# Altium schematic sheet Interface_Sheet.SchDoc
size 420 x 297 mm; SheetNumber: 3; SheetTotal: 4
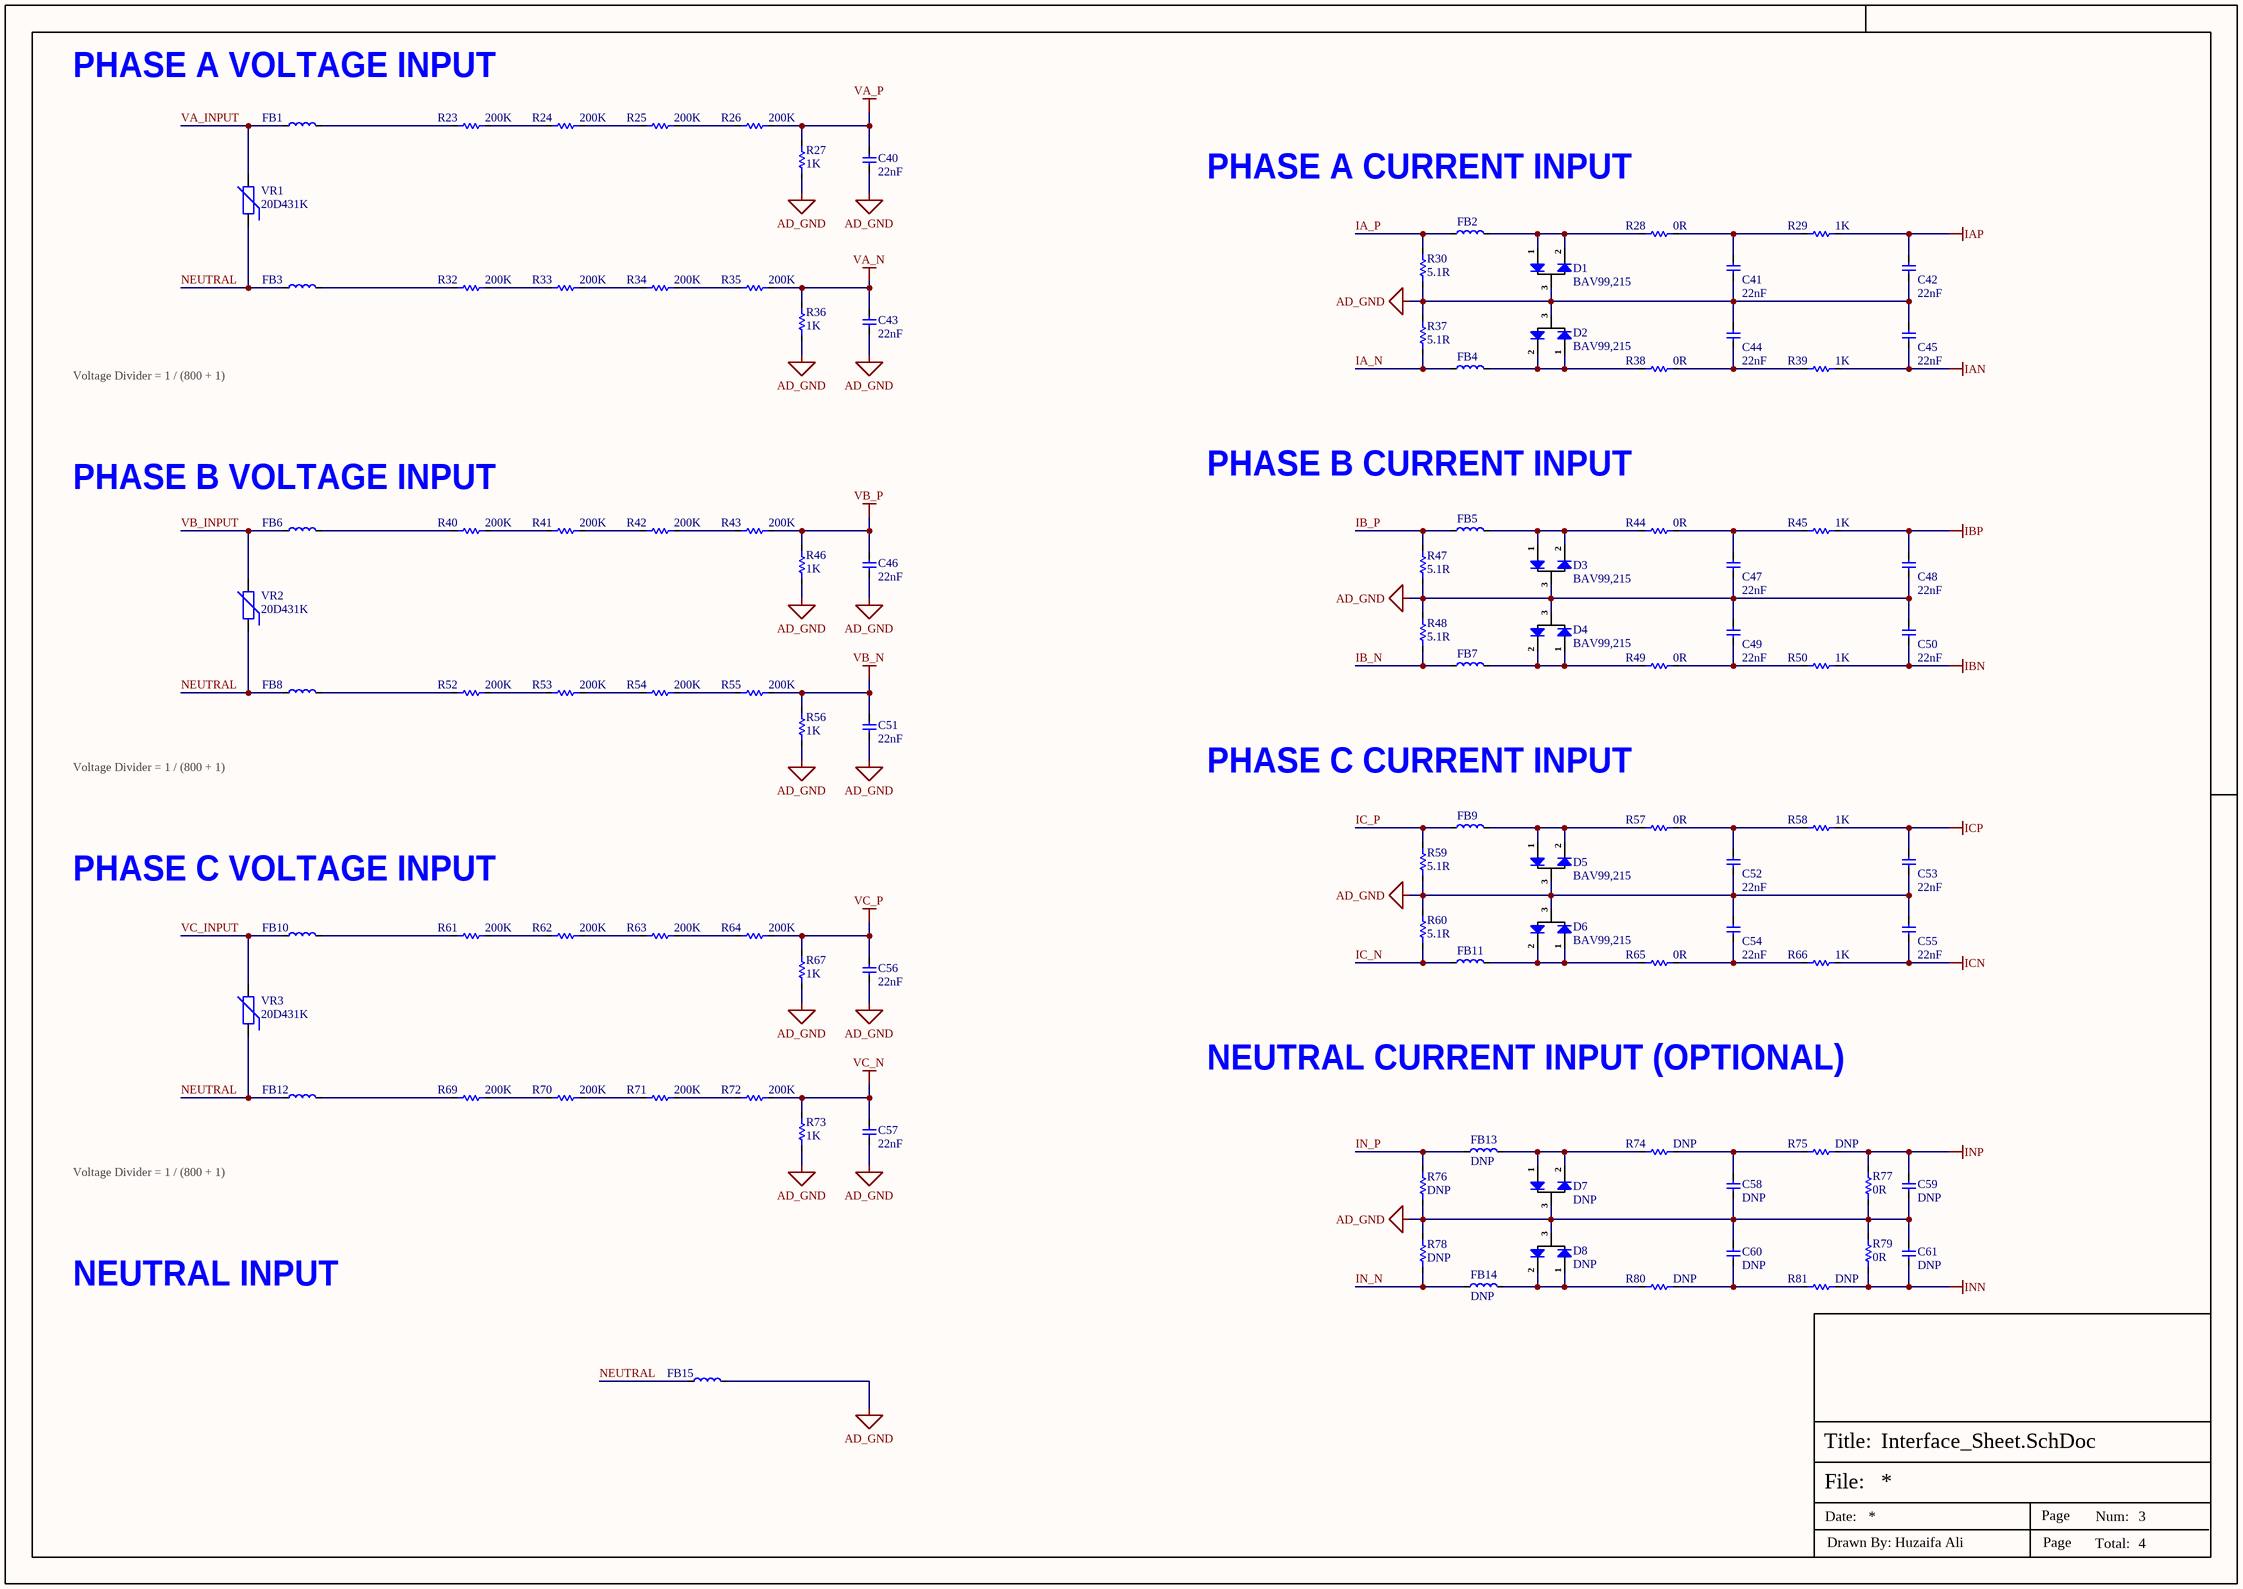
[diagram p0: Interface_Sheet.SchDoc]

## Parts
C40  22nF  [Cap-1206]
C41  22nF  [Cap-0603]
C42  22nF  [Cap-0603]
C43  22nF  [Cap-1206]
C44  22nF  [Cap-0603]
C45  22nF  [Cap-0603]
C46  22nF  [Cap-1206]
C47  22nF  [Cap-0603]
C48  22nF  [Cap-0603]
C49  22nF  [Cap-0603]
C50  22nF  [Cap-0603]
C51  22nF  [Cap-1206]
C52  22nF  [Cap-0603]
C53  22nF  [Cap-0603]
C54  22nF  [Cap-0603]
C55  22nF  [Cap-0603]
C56  22nF  [Cap-1206]
C57  22nF  [Cap-1206]
C58  DNP  [Cap-0805]  (no BOM)
C59  DNP  [Cap-0805]  (no BOM)
C60  DNP  [Cap-0805]  (no BOM)
C61  DNP  [Cap-0805]  (no BOM)
D1  BAV99,215  [SOT-23]
D2  BAV99,215  [SOT-23]
D3  BAV99,215  [SOT-23]
D4  BAV99,215  [SOT-23]
D5  BAV99,215  [SOT-23]
D6  BAV99,215  [SOT-23]
D7  DNP  [SOT-23]  (no BOM)
D8  DNP  [SOT-23]  (no BOM)
FB1  BLM21BD152SN1D  [Ind-0805]  (value not drawn)
FB2  BLM21BD152SN1D  [Ind-0805]  (value not drawn)
FB3  BLM21BD152SN1D  [Ind-0805]  (value not drawn)
FB4  BLM21BD152SN1D  [Ind-0805]  (value not drawn)
FB5  BLM21BD152SN1D  [Ind-0805]  (value not drawn)
FB6  BLM21BD152SN1D  [Ind-0805]  (value not drawn)
FB7  BLM21BD152SN1D  [Ind-0805]  (value not drawn)
FB8  BLM21BD152SN1D  [Ind-0805]  (value not drawn)
FB9  BLM21BD152SN1D  [Ind-0805]  (value not drawn)
FB10  BLM21BD152SN1D  [Ind-0805]  (value not drawn)
FB11  BLM21BD152SN1D  [Ind-0805]  (value not drawn)
FB12  BLM21BD152SN1D  [Ind-0805]  (value not drawn)
FB13  DNP  [Ind-0805]  (no BOM)
FB14  DNP  [Ind-0805]  (no BOM)
FB15  BLM21BD152SN1D  [Ind-0805]  (value not drawn)
R23  200K  [RES-2010]
R24  200K  [RES-2010]
R25  200K  [RES-2010]
R26  200K  [RES-2010]
R27  1K  [RES-2010]
R28  0R  [Res-0603]
R29  1K  [Res-0603]
R30  5.1R  [Res-1206]
R32  200K  [RES-2010]
R33  200K  [RES-2010]
R34  200K  [RES-2010]
R35  200K  [RES-2010]
R36  1K  [RES-2010]
R37  5.1R  [Res-1206]
R38  0R  [Res-0603]
R39  1K  [Res-0603]
R40  200K  [RES-2010]
R41  200K  [RES-2010]
R42  200K  [RES-2010]
R43  200K  [RES-2010]
R44  0R  [Res-0603]
R45  1K  [Res-0603]
R46  1K  [RES-2010]
R47  5.1R  [Res-1206]
R48  5.1R  [Res-1206]
R49  0R  [Res-0603]
R50  1K  [Res-0603]
R52  200K  [RES-2010]
R53  200K  [RES-2010]
R54  200K  [RES-2010]
R55  200K  [RES-2010]
R56  1K  [RES-2010]
R57  0R  [Res-0603]
R58  1K  [Res-0603]
R59  5.1R  [Res-1206]
R60  5.1R  [Res-1206]
R61  200K  [RES-2010]
R62  200K  [RES-2010]
R63  200K  [RES-2010]
R64  200K  [RES-2010]
R65  0R  [Res-0603]
R66  1K  [Res-0603]
R67  1K  [RES-2010]
R69  200K  [RES-2010]
R70  200K  [RES-2010]
R71  200K  [RES-2010]
R72  200K  [RES-2010]
R73  1K  [RES-2010]
R74  DNP  [Res-0603]  (no BOM)
R75  DNP  [Res-0603]  (no BOM)
R76  DNP  [Res-1206]
R77  0R  [Res-0402]
R78  DNP  [Res-1206]
R79  0R  [Res-0402]
R80  DNP  [Res-0603]  (no BOM)
R81  DNP  [Res-0603]  (no BOM)
VR1  20D431K  [20D431K]
VR2  20D431K  [20D431K]
VR3  20D431K  [20D431K]

## Nets
AD_GND: C40.1 C41.1 C42.1 C43.1 C44.2 C45.2 C46.1 C47.1 C48.1 C49.2 C50.2 C51.1 C52.1 C53.1 C54.2 C55.2 C56.1 C57.1 C58.1 C59.1 C60.2 C61.2 D1.3 D2.3 D3.3 D4.3 D5.3 D6.3 D7.3 D8.3 FB15.2 R27.1 R30.1 R36.1 R37.2 R46.1 R47.1 R48.2 R56.1 R59.1 R60.2 R67.1 R73.1 R76.1 R77.1 R78.2 R79.2
IAN: C45.1 R39.2
IAP: C42.2 R29.2
IBN: C50.1 R50.2
IBP: C48.2 R45.2
ICN: C55.1 R66.2
ICP: C53.2 R58.2
INN: C61.1 R79.1 R81.2
INP: C59.2 R75.2 R77.2
VA_N: C43.2 R35.2 R36.2
VA_P: C40.2 R26.2 R27.2
VB_N: C51.2 R55.2 R56.2
VB_P: C46.2 R43.2 R46.2
VC_N: C57.2 R72.2 R73.2
VC_P: C56.2 R64.2 R67.2
IA_N: FB4.1 R37.1
IA_P: FB2.1 R30.2
IB_N: FB7.1 R48.1
IB_P: FB5.1 R47.2
IC_N: FB11.1 R60.1
IC_P: FB9.1 R59.2
IN_N: FB14.1 R78.1
IN_P: FB13.1 R76.2
NEUTRAL: FB3.1 FB8.1 FB12.1 FB15.1 VR1.1 VR2.1 VR3.1
VA_INPUT: FB1.1 VR1.2
VB_INPUT: FB6.1 VR2.2
VC_INPUT: FB10.1 VR3.2
NetC41_2: C41.2 R28.2 R29.1
NetC44_1: C44.1 R38.2 R39.1
NetC47_2: C47.2 R44.2 R45.1
NetC49_1: C49.1 R49.2 R50.1
NetC52_2: C52.2 R57.2 R58.1
NetC54_1: C54.1 R65.2 R66.1
NetC58_2: C58.2 R74.2 R75.1
NetC60_1: C60.1 R80.2 R81.1
NetD1_1: D1.1 D1.2 FB2.2 R28.1
NetD2_1: D2.1 D2.2 FB4.2 R38.1
NetD3_1: D3.1 D3.2 FB5.2 R44.1
NetD4_1: D4.1 D4.2 FB7.2 R49.1
NetD5_1: D5.1 D5.2 FB9.2 R57.1
NetD6_1: D6.1 D6.2 FB11.2 R65.1
NetD7_1: D7.1 D7.2 FB13.2 R74.1
NetD8_1: D8.1 D8.2 FB14.2 R80.1
NetFB1_2: FB1.2 R23.1
NetFB3_2: FB3.2 R32.1
NetFB6_2: FB6.2 R40.1
NetFB8_2: FB8.2 R52.1
NetFB10_2: FB10.2 R61.1
NetFB12_2: FB12.2 R69.1
NetR23_2: R23.2 R24.1
NetR24_2: R24.2 R25.1
NetR25_2: R25.2 R26.1
NetR32_2: R32.2 R33.1
NetR33_2: R33.2 R34.1
NetR34_2: R34.2 R35.1
NetR40_2: R40.2 R41.1
NetR41_2: R41.2 R42.1
NetR42_2: R42.2 R43.1
NetR52_2: R52.2 R53.1
NetR53_2: R53.2 R54.1
NetR54_2: R54.2 R55.1
NetR61_2: R61.2 R62.1
NetR62_2: R62.2 R63.1
NetR63_2: R63.2 R64.1
NetR69_2: R69.2 R70.1
NetR70_2: R70.2 R71.1
NetR71_2: R71.2 R72.1

## Notes on the sheet
- PHASE A VOLTAGE INPUT
- PHASE A CURRENT INPUT
- Voltage Divider = 1 / (800 + 1)
- PHASE B CURRENT INPUT
- PHASE B VOLTAGE INPUT
- PHASE C CURRENT INPUT
- PHASE C VOLTAGE INPUT
- NEUTRAL CURRENT INPUT (OPTIONAL)
- NEUTRAL INPUT
- File:
- Title:
- Date:
- Page
- Num:
- Total:
- Drawn By: Huzaifa Ali

## Library data of the parts
C40 C43 C46 C51 C56 C57 = CC1206KKX7RBBB223: CAP CER 0.022UF 500V X7R 1206; Manufacturer: Yageo; Item Type: Capacitors; Supplier: Future Electronics; LCSC Part Number: C326702; Manufacturer Part Number: CC1206KKX7RBBB223; RoHS: Yes; Stock: 660000; Pricing: 3000=0.0421, 6000=0.0414, 12000=0.0407, 15000=0.0405, 45000=0.0392 (USD); Lead Free: 5697LeadFree; ComponentLink1URL: http://www.mouser.com/ds/2/447/Yageo_UPY-GP_NP0_16V-to-50V_9-358835.pdf?src-supplier=Mouser; ComponentLink1Description: http://www.mouser.com/ds/2/447/Yageo_UPY-GP_NP0_16V-to-50V_9-358835.pdf?src-supplier=Mouser; ComponentLink2URL: http://www.yageo.com/documents/recent/UPY-NP0X7R_MV_100-to-630V_9.pdf?src-supplier=Avnet; ComponentLink2Description: http://www.yageo.com/documents/recent/UPY-NP0X7R_MV_100-to-630V_9.pdf?src-supplier=Avnet; ComponentLink3URL: http://www.yageo.com/documents/recent/UPY-NP0X7R_MV_100-to-630V_19.pdf?src-supplier=Digikey; ComponentLink3Description: http://www.yageo.com/documents/recent/UPY-NP0X7R_MV_100-to-630V_19.pdf?src-supplier=Digikey; ComponentLink4URL: http://www.yageo.com/documents/recent/UPY-NP0X7R_MV_100-to-630V_21.pdf?src-supplier=Digikey; ComponentLink4Description: http://www.yageo.com/documents/recent/UPY-NP0X7R_MV_100-to-630V_21.pdf?src-supplier=Digikey; ComponentLink5URL: https://www.yageo.com/upload/media/product/products/datasheet/mlcc/UPY-NP0X7R_MV_100-to-630V_21.pdf?src-supplier=Digikey; ComponentLink5Description: https://www.yageo.com/upload/media/product/products/datasheet/mlcc/UPY-NP0X7R_MV_100-to-630V_21.pdf?src-supplier=Digikey; ComponentLink6URL: http://www.yageo.com/documents/recent/UPY-NP0X7R_MV_100-to-630V_9.pdf?src-supplier=Future+Electronics; ComponentLink6Description: http://www.yageo.com/documents/recent/UPY-NP0X7R_MV_100-to-630V_9.pdf?src-supplier=Future+Electronics; ComponentLink7URL: https://datasheet.octopart.com/CC1206KKX7RBBB223-Yageo-datasheet-10979222.pdf?src-supplier=Future+Electronics; ComponentLink7Description: https://datasheet.octopart.com/CC1206KKX7RBBB223-Yageo-datasheet-10979222.pdf?src-supplier=Future+Electronics
C41 C42 C44 C45 C47-C50 C52-C55 = CC0603KRX7R9BB223: CAP CER 0.022UF 50V X7R 0603; Manufacturer: Yageo; Item Type: Capacitor; Dielectric Material: Ceramic; Tolerance: 10%; Insulation Resistance: 100GR; LCSC Part Number: C106222; Manufacturer Part Number: CC0603KRX7R9BB223; RoHS: Yes; Lead Free: Lead Free; ComponentLink1URL: https://datasheet.ciiva.com/8033/70765-8033869.pdf?src-supplier=Element14; ComponentLink1Description: https://datasheet.ciiva.com/8033/70765-8033869.pdf?src-supplier=Element14; ComponentLink2URL: https://datasheet.ciiva.com/28450/1489800-28450639.pdf?src-supplier=Element14; ComponentLink2Description: https://datasheet.ciiva.com/28450/1489800-28450639.pdf?src-supplier=Element14; ComponentLink3URL: https://datasheet.ciiva.com/8033/1489800-8033867.pdf?src-supplier=Element14; ComponentLink3Description: https://datasheet.ciiva.com/8033/1489800-8033867.pdf?src-supplier=Element14; ComponentLink4URL: https://datasheet.ciiva.com/8033/1489800-8033865.pdf?src-supplier=Element14; ComponentLink4Description: https://datasheet.ciiva.com/8033/1489800-8033865.pdf?src-supplier=Element14; ComponentLink5URL: https://datasheet.ciiva.com/156/mlccorderingcode-156178.pdf?src-supplier=Digi-Key; ComponentLink5Description: https://datasheet.ciiva.com/156/mlccorderingcode-156178.pdf?src-supplier=Digi-Key; ComponentLink6URL: https://datasheet.ciiva.com/156/mlccorderingcode-156177.pdf?src-supplier=Digi-Key; ComponentLink6Description: https://datasheet.ciiva.com/156/mlccorderingcode-156177.pdf?src-supplier=Digi-Key; ComponentLink7URL: https://datasheet.ciiva.com/156/mlccorderingcode-156179.pdf?src-supplier=Digi-Key; ComponentLink7Description: https://datasheet.ciiva.com/156/mlccorderingcode-156179.pdf?src-supplier=Digi-Key; ComponentLink8URL: https://datasheet.ciiva.com/11464/upy-gphc-x7r-6-3v-to-50v-8-11464741.pdf?src-supplier=Avnet; ComponentLink8Description: https://datasheet.ciiva.com/11464/upy-gphc-x7r-6-3v-to-50v-8-11464741.pdf?src-supplier=Avnet; Supplier 1: Digi-Key; Category: Ceramic Capacitors; Stock 1: 119735; Pricing 1: 1=0.10000, 10=0.05500, 50=0.03020, 100=0.02460, 500=0.01760, 1000=0.01383 (USD); Mount: Surface Mount; Case/Package: 0603; Number of Pins: 2; Case Code (Metric): 1608; Case Code (Imperial): 0603; Min Operating Temperature: -55°C; Max Operating Temperature: 125°C; Capacitance: 22nF; Dielectric: X7R; Voltage: 50V; Package Quantity: 1; Voltage Rating: 50V; Packaging: Tape and Reel; Voltage Rating (DC): 50V; Termination: SMD/SMT; Resistor Type: Ceramic; Series: CC; Length: 1.6mm; Width: 0.031inch; Height: 0.8mm; Depth: 0.8mm; Thickness: 0.035inch; Radiation Hardening: No; RoHS Compliant: Yes; REACH SVHC: No SVHC; Halogen Free: Halogen Free; Supplier Part Number 1: 311-1370-1-ND
C58-C61 = GRM21B5C1H223JA01L: CAP CER 0.022UF 50V C0G/NP0 0805; Manufacturer: Murata; Item Type: Capacitors; Supplier: Mouser; LCSC Part Number: C77069; Manufacturer Part Number: GRM21B5C1H223JA01L; RoHS: Yes; Stock: 33939; Pricing: 1=0.38, 10=0.162, 50=0.162, 100=0.108, 1000=0.089, 10000=0.065 (USD); Lead Free: 5697LeadFree; ComponentLink1URL: https://datasheet.ciiva.com/29042/1858738-29042965.pdf?src-supplier=Jameco; ComponentLink1Description: https://datasheet.ciiva.com/29042/1858738-29042965.pdf?src-supplier=Jameco; ComponentLink2URL: https://datasheet.ciiva.com/2989/product-2989681.pdf?src-supplier=Avnet; ComponentLink2Description: https://datasheet.ciiva.com/2989/product-2989681.pdf?src-supplier=Avnet; ComponentLink3URL: https://datasheet.ciiva.com/3777/99grm21b5c1h223ja0123-3777023.pdf?src-supplier=Arrow+Electronics; ComponentLink3Description: https://datasheet.ciiva.com/3777/99grm21b5c1h223ja0123-3777023.pdf?src-supplier=Arrow+Electronics; ComponentLink4URL: https://datasheet.ciiva.com/29200/453051-da-01-en-vs-kondensator-0805-29200670.pdf?src-supplier=Conrad; ComponentLink4Description: https://datasheet.ciiva.com/29200/453051-da-01-en-vs-kondensator-0805-29200670.pdf?src-supplier=Conrad; ComponentLink5URL: https://datasheet.ciiva.com/138/partnumbering-e-01-138787.pdf?src-supplier=Digikey; ComponentLink5Description: https://datasheet.ciiva.com/138/partnumbering-e-01-138787.pdf?src-supplier=Digikey; ComponentLink6URL: https://datasheet.ciiva.com/138/partnumbering-e-01-138788.pdf?src-supplier=Digikey; ComponentLink6Description: https://datasheet.ciiva.com/138/partnumbering-e-01-138788.pdf?src-supplier=Digikey; ComponentLink7URL: https://datasheet.ciiva.com/138/partnumbering-e-01-138789.pdf?src-supplier=Digikey; ComponentLink7Description: https://datasheet.ciiva.com/138/partnumbering-e-01-138789.pdf?src-supplier=Digikey; ComponentLink8URL: https://datasheet.ciiva.com/22703/608985-22703464.pdf?src-supplier=Element14; ComponentLink8Description: https://datasheet.ciiva.com/22703/608985-22703464.pdf?src-supplier=Element14; ComponentLink9URL: https://datasheet.ciiva.com/7828/608985-7828990.pdf?src-supplier=Element14; ComponentLink9Description: https://datasheet.ciiva.com/7828/608985-7828990.pdf?src-supplier=Element14
D1-D8 = BAV99,215: DIODE ARR GP 100V 215MA TO-236AB; Manufacturer: Nexperia; Item Type: Diodes; Forward Voltage: 1.25V; Breakdown Voltage: 75V; Forward Current: 125mA; Max Forward Surge Current (Ifsm): 500mA; Max Reverse Current: 500nA; Value: 1.5pF; Supplier: Future Electronics; LCSC Part Number: C2500; Manufacturer Part Number: BAV99,215; RoHS: Yes; Stock: 20217000; Pricing: 3000=0.008, 12000=0.0077, 30000=0.0075, 75000=0.0073, 120000=0.007 (USD); Pins: 3NUMBER; Max Operating Temperature: 150°C; Max Repetitive Reverse Voltage (Vrrm): 100V; Reverse Voltage: 100V; Height: 1.1mm; RoHS Compliant: Yes; ComponentLink1URL: http://www.farnell.com/datasheets/953882.pdf?src-supplier=Farnell; ComponentLink1Description: http://www.farnell.com/datasheets/953882.pdf?src-supplier=Farnell; ComponentLink2URL: http://www.farnell.com/datasheets/953882.pdf?src-supplier=Newark; ComponentLink2Description: http://www.farnell.com/datasheets/953882.pdf?src-supplier=Newark; ComponentLink3URL: https://datasheet.octopart.com/BAV99%2C215-Nexperia-datasheet-10109661.pdf?src-supplier=Element14; ComponentLink3Description: https://datasheet.octopart.com/BAV99%2C215-Nexperia-datasheet-10109661.pdf?src-supplier=Element14; ComponentLink4URL: https://assets.nexperia.com/documents/data-sheet/BAV99_SER.pdf?src-supplier=Digikey; ComponentLink4Description: https://assets.nexperia.com/documents/data-sheet/BAV99_SER.pdf?src-supplier=Digikey; ComponentLink5URL: https://datasheet.octopart.com/BAV99%2C215-Nexperia-datasheet-87580883.pdf?src-supplier=Newark; ComponentLink5Description: https://datasheet.octopart.com/BAV99%2C215-Nexperia-datasheet-87580883.pdf?src-supplier=Newark
FB1-FB15 = BLM21BD152SN1D: FERRITE BEAD 1.5 KOHM 0805 1LN; Manufacturer: Murata; Item Type: Ferrite Beads; RMS Current (Irms): 250mA; ESR: 450mR; Shielding: 202Shielding; Frequency: 100MHz; Number of Circuits: 1NUMBER; Supplier: Mouser; LCSC Part Number: C413959; Manufacturer Part Number: BLM21BD152SN1D; RoHS: Yes; Stock: 31999; Pricing: 1=0.21, 10=0.114, 50=0.114, 100=0.102, 1000=0.068, 10000=0.048 (USD); Lead Free: 5697LeadFree; ComponentLink1URL: https://datasheet.ciiva.com/19454/1845267-19454720.pdf?src-supplier=Jameco; ComponentLink1Description: https://datasheet.ciiva.com/19454/1845267-19454720.pdf?src-supplier=Jameco; ComponentLink2URL: https://datasheet.ciiva.com/14122/amblm21b-data-e-14122891.pdf?src-supplier=Distrelec; ComponentLink2Description: https://datasheet.ciiva.com/14122/amblm21b-data-e-14122891.pdf?src-supplier=Distrelec; ComponentLink3URL: https://datasheet.ciiva.com/6211/l0110s0100blm21b-6211484.pdf?src-supplier=Digikey; ComponentLink3Description: https://datasheet.ciiva.com/6211/l0110s0100blm21b-6211484.pdf?src-supplier=Digikey; ComponentLink4URL: https://datasheet.ciiva.com/6211/l0110s0100blm21b-6211486.pdf?src-supplier=Digikey; ComponentLink4Description: https://datasheet.ciiva.com/6211/l0110s0100blm21b-6211486.pdf?src-supplier=Digikey; ComponentLink5URL: https://datasheet.ciiva.com/6211/l0110s0100blm21b-6211487.pdf?src-supplier=Digikey; ComponentLink5Description: https://datasheet.ciiva.com/6211/l0110s0100blm21b-6211487.pdf?src-supplier=Digikey; ComponentLink6URL: https://datasheet.ciiva.com/16420/l0110s0100blm21b-16420715.pdf?src-supplier=Future+Electronics; ComponentLink6Description: https://datasheet.ciiva.com/16420/l0110s0100blm21b-16420715.pdf?src-supplier=Future+Electronics; ComponentLink7URL: https://datasheet.ciiva.com/17277/l0110s0100blm21b-17277370.pdf?; ComponentLink7Description: https://datasheet.ciiva.com/17277/l0110s0100blm21b-17277370.pdf?
R23-R26 R32-R35 R40-R43 R52-R55 R61-R64 R69-R72 = FRC2010J204 TS: 0.75W Thick Film Resistors 200V ±100ppm/℃ ±5% 200kΩ 2010 Chip Resistor - Surface Mount ROHS; Manufacturer: FOJAN; LCSC Part Number: C2960872; Manufacturer Part Number: FRC2010J204 TS; Item Type: Resistor; ComponentLink1URL: https://www.lcsc.com/product-detail/Chip-Resistor-Surface-Mount_FOJAN-FRC2010J204-TS_C2960872.html?s_z=n_CRCW2010200KJNEF; ComponentLink1Description: LCSC; Package: 2010
R27 R36 R46 R56 R67 R73 = HP101WJ0102T4E: 1W 1kΩ 300V ±100ppm/℃ Thick Film Resistor ±5% 2010 Chip Resistor - Surface Mount RoHS; Manufacturer: UNI-ROYAL; Manufacturer Part Number: HP101WJ0102T4E; ComponentLink1URL: https://www.lcsc.com/product-detail/C2758967.html; ComponentLink1Description: LCSC; LCSC Part Number: C2758967; Item Type: Resistor; Package: 2010
R28 R38 R44 R49 R57 R65 R74 R80 = RC0603FR-070RL: RES SMD 0R, 1%, 0.1W, 0603; Manufacturer: Yageo; Item Type: Resistor; Manufacturer Part Number: RC0603FR-070RL; Package: 0603; LCSC Part Number: C100044; ComponentLink9Description: LCSC; ComponentLink9URL: https://www.lcsc.com/product-detail/Chip-Resistor-Surface-Mount_YAGEO-RC0603FR-070RL_C100044.html
R29 R39 R45 R50 R58 R66 R75 R81 = RC0603FR-071KL: RES SMD 1K OHM 1% 1/10W 0603; Manufacturer: Yageo; Resistance: 1kR; Temperature Coefficient: 100ppm/°C; Power Rating: 100mW; Voltage Rating: 50V; Item type: Resistor; ComponentLink1URL: https://www.verical.com/server-webapp/html/getDatasheet?partID=409289&src-supplier=Verical; ComponentLink1Description: https://www.verical.com/server-webapp/html/getDatasheet?partID=409289&src-supplier=Verical; Supplier 1: Digi-Key; Manufacturer Part Number: RC0603FR-071KL; Stock 1: 21472395; Pricing 1: 1=0.1, 10=0.023, 100=0.0094, 1000=0.0042, 2500=0.0037 (USD); Case/Package: 0603; Contact Plating: Tin,Matte; Case Code (Imperial): 0603; Case Code (Metric): 1608; Min Operating Temperature: -55°C; Max Operating Temperature: 155°C; Tolerance: 1%; Composition: Thick Film; Packaging: Tape and Reel; Termination: SMD/SMT; Military Standard: Not; Length: 1.6mm; Height: 0.45mm; Depth: 0.8mm; Radiation Hardening: No; REACH SVHC: No SVHC; Lead Free: Lead Free; ComponentLink2URL: http://documents.rs-components.com/techlib://itc_doclist_GB.htm?stockno=5048928&src-supplier=RSComponents; ComponentLink2Description: http://documents.rs-components.com/techlib://itc_doclist_GB.htm?stockno=5048928&src-supplier=RSComponents; ComponentLink3URL: http://www.yageo.com/documents/recent/PYu-RC0603_51_RoHS_L_4.pdf?src-supplier=Avnet+Europe; ComponentLink3Description: http://www.yageo.com/documents/recent/PYu-RC0603_51_RoHS_L_4.pdf?src-supplier=Avnet+Europe; ComponentLink4URL: http://www.farnell.com/datasheets/2167052.pdf?src-supplier=Element14; ComponentLink4Description: http://www.farnell.com/datasheets/2167052.pdf?src-supplier=Element14; ComponentLink5URL: http://www.farnell.com/datasheets/1868787.pdf?src-supplier=Element14; ComponentLink5Description: http://www.farnell.com/datasheets/1868787.pdf?src-supplier=Element14; ComponentLink6URL: http://www.yageo.com/documents/recent/PYu-RC_Group_51_RoHS_L_2.pdf?src-supplier=Avnet; ComponentLink6Description: http://www.yageo.com/documents/recent/PYu-RC_Group_51_RoHS_L_2.pdf?src-supplier=Avnet; ComponentLink7URL: https://www.verical.com/server-webapp/html/getDatasheet?partID=404327&src-supplier=Verical; ComponentLink7Description: https://www.verical.com/server-webapp/html/getDatasheet?partID=404327&src-supplier=Verical; ComponentLink8URL: http://www.farnell.com/datasheets/443971.pdf?src-supplier=Element14; ComponentLink8Description: http://www.farnell.com/datasheets/443971.pdf?src-supplier=Element14; Supplier Part Number 1: 311-1.00KHRDKR-ND; LCSC Part Number: C22548
R30 R37 R47 R48 R59 R60 R76 R78 = RC1206JR-075R1L: RES 5.1 OHM 5% 1/4W 1206; Manufacturer: Yageo; Item Type: Resistor; Supplier: Future Electronics; Supplier Part Number: 2133981; Manufacturer Part Number: RC1206JR-075R1L; RoHS: Yes; Category: Chip SMD Resistors; Stock: 30000; Pricing: 5000=0.0086, 25000=0.0082, 125000=0.0078, 250000=0.0076, 750000=0.0071 (USD); ComponentLink1URL: https://datasheet.ciiva.com/2459/pyu-r-int-thick-7-2459118.pdf?src-supplier=Digikey; ComponentLink1Description: https://datasheet.ciiva.com/2459/pyu-r-int-thick-7-2459118.pdf?src-supplier=Digikey; ComponentLink2URL: https://datasheet.ciiva.com/2459/pyu-r-int-thick-7-2459119.pdf?src-supplier=Digikey; ComponentLink2Description: https://datasheet.ciiva.com/2459/pyu-r-int-thick-7-2459119.pdf?src-supplier=Digikey; ComponentLink3URL: https://datasheet.ciiva.com/2459/pyu-r-int-thick-7-2459120.pdf?src-supplier=Digikey; ComponentLink3Description: https://datasheet.ciiva.com/2459/pyu-r-int-thick-7-2459120.pdf?src-supplier=Digikey; LCSC Part Number: C163357
R77 R79 = RC0402FR-070RL: RES 0 OHM JUMPER 1/16W 0402; Manufacturer: Yageo; Item Type: Resistors; Tolerance: 1%; Power Rating: 62.5mW; Voltage Rating: 50V; Temperature Coefficient: 200ppm/°C; Max Power Dissipation: 63mW; Manufacturer Part Number: RC0402FR-070RL; LCSC Part Number: C106231; Supplier 1: Mouser; RoHS: Yes; Stock 1: 8556842; Pricing 1: 1=0.10000, 10=0.01400, 50=0.01400, 100=0.00600, 1000=0.00300, 5000=0.00200, 10000=0.00100 (USD); Mount: Surface Mount; Case/Package: 0402; Contact Plating: Tin,Matte; Case Code (Imperial): 0402; Case Code (Metric): 1005; Size Code: 0402; Min Operating Temperature: -55°C; Max Operating Temperature: 155°C; Resistance: 0R; Resistor Type: Thick Film; Packaging: Tape and Reel; Termination: SMD/SMT; Features: Moisture Resistant; Series: RC; Number of Terminations: 2; Length: 1mm; Width: 0.5mm; Height: 0.35mm; Radiation Hardening: No; Lead Free: Lead Free; RoHS Compliant: Yes; ComponentLink1URL: https://datasheet.ciiva.com/8896/pyu-rc0402-51-rohs-l-6-8896149.pdf?src-supplier=Avnet; ComponentLink1Description: https://datasheet.ciiva.com/8896/pyu-rc0402-51-rohs-l-6-8896149.pdf?src-supplier=Avnet; ComponentLink2URL: https://datasheet.ciiva.com/16790/pyu-rc0402-51-rohs-l-6-r-16790444.pdf?src-supplier=Future+Electronics; ComponentLink2Description: https://datasheet.ciiva.com/16790/pyu-rc0402-51-rohs-l-6-r-16790444.pdf?src-supplier=Future+Electronics; Supplier Part Number 1: 603-RC0402FR-070RL
VR1-VR3 = 20D431K: 710V 350V 275V Through Hole,P=10mm Varistors ROHS; Manufacturer: SURGING; Manufacturer Part Number: 20D431K; Package: Through Hole,P=10mm; LCSC Part Number: C2839534; Item Type: Varistor; ComponentLink1Description: LCSC; ComponentLink1URL: https://www.lcsc.com/product-detail/C2839534.html